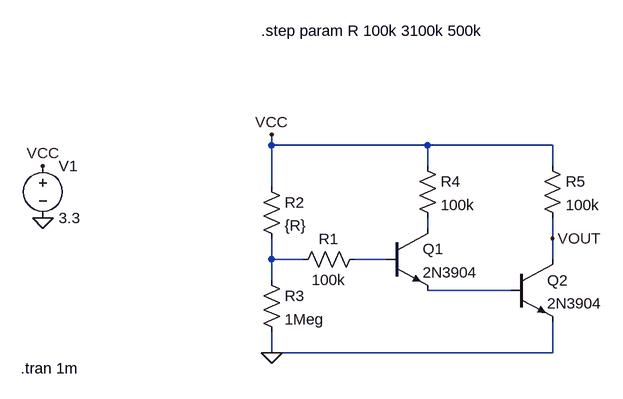
[diagram p0: schematic sensor_water_level.asc]
sensor_water_level.asc, the LTspice schematic file:
Version 4
SHEET 1 880 680
WIRE 48 -16 48 -32
WIRE 288 -16 48 -16
WIRE 480 -16 288 -16
WIRE 288 16 288 -16
WIRE 480 16 480 -16
WIRE 48 48 48 -16
WIRE 288 112 288 96
WIRE 480 128 480 96
WIRE 48 160 48 128
WIRE 96 160 48 160
WIRE 224 160 176 160
WIRE 480 160 480 128
WIRE 48 192 48 160
WIRE 416 208 288 208
WIRE 48 304 48 272
WIRE 480 304 480 256
WIRE 480 304 48 304
FLAG -304 96 0
FLAG -304 16 VCC
FLAG 48 -32 VCC
FLAG 48 304 0
FLAG 480 128 VOUT
SYMBOL res 80 176 R270
WINDOW 0 32 56 VTop 2
WINDOW 3 0 56 VBottom 2
SYMATTR InstName R1
SYMATTR Value 100k
SYMBOL res 32 32 R0
SYMATTR InstName R2
SYMATTR Value {R}
SYMBOL res 32 176 R0
SYMATTR InstName R3
SYMATTR Value 1Meg
SYMBOL res 272 0 R0
SYMATTR InstName R4
SYMATTR Value 100k
SYMBOL res 464 0 R0
SYMATTR InstName R5
SYMATTR Value 100k
SYMBOL voltage -304 0 R0
WINDOW 123 0 0 Left 0
WINDOW 39 0 0 Left 0
SYMATTR InstName V1
SYMATTR Value 3.3
SYMBOL npn 224 112 R0
SYMATTR InstName Q1
SYMATTR Value 2N3904
SYMBOL npn 416 160 R0
SYMATTR InstName Q2
SYMATTR Value 2N3904
TEXT 32 -192 Left 2 !.step param R 100k 3100k 500k
TEXT -338 328 Left 2 !.tran 1m

The netlist it stands for:
* sensor_water_level.asc
R1 N002 N003 100k
R2 VCC N002 {R}
R3 N002 0 1Meg
R4 VCC N001 100k
R5 VCC VOUT 100k
V1 VCC 0 3.3
Q1 N001 N003 N004 0 2N3904
Q2 VOUT N004 0 0 2N3904
.model NPN NPN
.model PNP PNP
.lib standard.bjt
.step param R 100k 3100k 500k
.tran 1m
.backanno
.end